# EasyEDA Pro project li-chuang-kai-fa-ban-li-chuang-coloreasypico2-kai-fa-ban-7911d14e.epro, schematic Schematic1_V1.0.4
Board Name: ColorEasyPico2_V1.0.4; Create Date: 2025-02-17; Page Name: P1; Project Name: 立创·ColorEasyPico2开发板; Schematic Name: Schematic1_V1.0.4; Update Date: 2025-02-19; Company: 嘉立创EDA; Page Size: A4; Reviewed: 嘉立创EDA
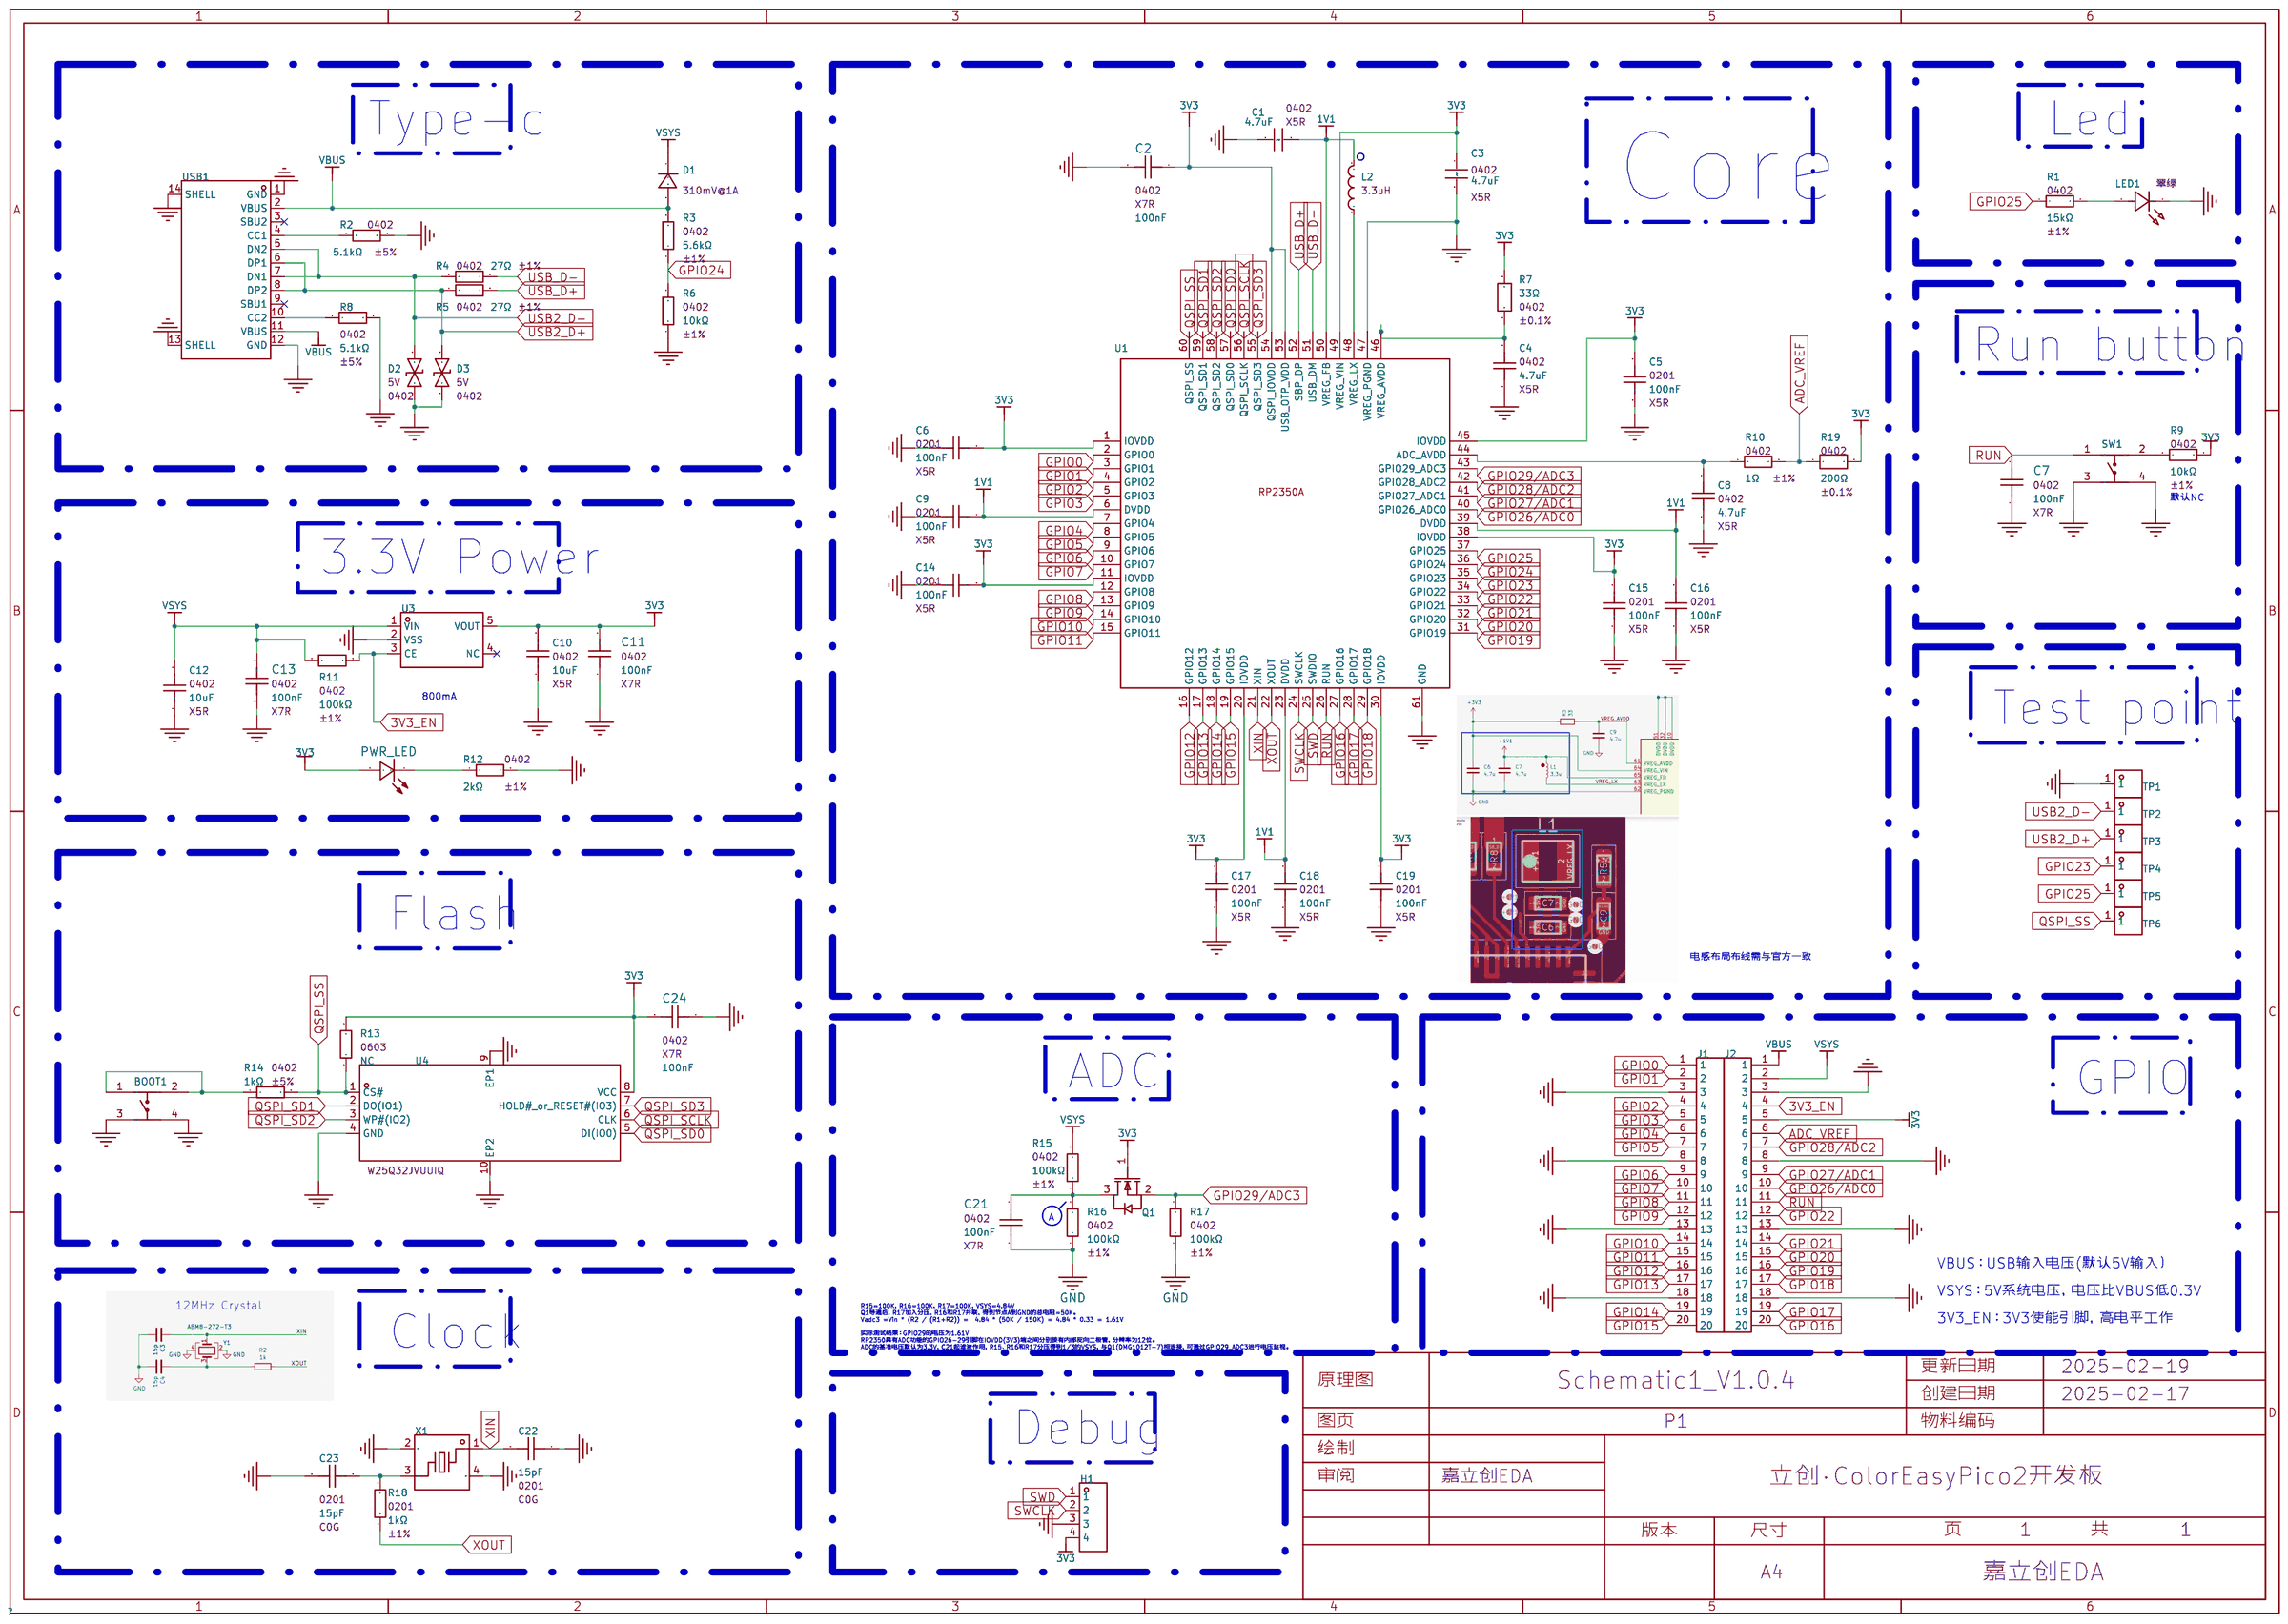
[diagram p0: schematic sheet]

## Parts
BOOT1  K2-1808SN-A4SW-01  [KEY-SMD_4P-L4.2-W3.2-P2.20-LS5.1-TL]
C1  4.7uF  [C0402]
C2  100nF  [R0402]
C3  4.7uF  [C0402]
C4  4.7uF  [R0402]
C5  100nF  [R0201]
C6  100nF  [R0201]
C7  100nF  [R0402]
C8  4.7uF  [R0402]
C9  100nF  [R0201]
C10  10uF  [R0402]
C11  100nF  [R0402]
C12  10uF  [R0402]
C13  100nF  [R0402]
C14  100nF  [R0201]
C15  100nF  [R0201]
C16  100nF  [R0201]
C17  100nF  [R0201]
C18  100nF  [R0201]
C19  100nF  [R0201]
C21  100nF  [R0402]
C22  15pF  [R0201]
C23  15pF  [R0201]
C24  100nF  [R0402]
D1  DFLS130L-7  [POWERDI-123_L2.8-W1.8-LS3.7-RD]
D2  RCLAMP0521P.TCT-MS  [D0402-BI]
D3  RCLAMP0521P.TCT-MS  [D0402-BI]
H1  2.54-1*4  [HDR-TH_4P-P2.54-V-M-1]  (no BOM)
J1  -  [半孔-孔-20P-2.54-1.27-无丝印]  (no BOM)
J2  -  [半孔-孔-20P-2.54-1.27-无丝印]  (no BOM)
L2  AOTA-B201610S3R3-101-T  [IND-SMD_L2.0-W1.6_AOTA-B201610S3R3-101-T]
LED1  XL-1005UGC  [LED0402-RD_GREEN]
PWR_LED  NCD0402R1  [LED0402-RD]
Q1  DMG1012T-7  [SOT-523-3_L1.6-W0.8-P1.00-LS1.6-BR]
R1  15kΩ  [R0402]
R2  5.1kΩ  [R0402]
R3  5.6kΩ  [R0402]
R4  27Ω  [R0402]
R5  27Ω  [R0402]
R6  10kΩ  [R0402]
R7  33Ω  [R0402]
R8  5.1kΩ  [R0402]
R9  10kΩ  [R0402]  (no BOM)
R10  1Ω  [R0402]
R11  100kΩ  [R0402]
R12  2kΩ  [R0402]
R13  NC  [R0402]  (no BOM)
R14  1kΩ  [R0402]
R15  100kΩ  [R0402]
R16  100kΩ  [R0402]
R17  100kΩ  [R0402]
R18  1kΩ  [R0201]
R19  200Ω  [R0402]
SW1  K2-1808SN-A4SW-01  [KEY-SMD_4P-L4.2-W3.2-P2.20-LS5.1-TL]
TP1  TP-红色测试点  [TESTPOINT-TH_BD3.2]  (no BOM)
TP2  TP-红色测试点  [TESTPOINT-TH_BD3.2]  (no BOM)
TP3  TP-红色测试点  [TESTPOINT-TH_BD3.2]  (no BOM)
TP4  TP-红色测试点  [TESTPOINT-TH_BD3.2]  (no BOM)
TP5  TP-红色测试点  [TESTPOINT-TH_BD3.2]  (no BOM)
TP6  TP-红色测试点  [TESTPOINT-TH_BD3.2]  (no BOM)
U1  RP2350A  [QFN-60_L7.0-W7.0-P0.40-TL-EP3.4]
U3  ME6217C33M5G  [SOT-23-5_L3.0-W1.7-P0.95-LS2.8-BR]
U4  W25Q32JVUUIQ  [USON-8_L4.0-W3.0-P0.80-BL_WINBOND_UU]
USB1  TYPE-C 16PIN 2MD(073)  [USB-C-SMD_TYPE-C-6PIN-2MD-073]
X1  ABM8-272-T3  [CRYSTAL-SMD_4P-L3.2-W2.5-BL]

## Library data of the parts
BOOT1 SW1 = K2-1808SN-A4SW-01: 触点电流:50mA;额定电压(DC):12V;绝缘电阻:100MΩ;电路结构:单刀单掷;安装方式:立贴;按钮形状:椭圆形按钮;带灯:-;作用力:250gf@±30gf;机械寿命:100000;工作温度:-25℃~+85℃;开关长度:4.2mm;开关宽度:3.25mm;开关高度:2.5mm;; Circuit: 单刀单掷; Supplier: LCSC; Datasheet: https://atta.szlcsc.com/upload/public/pdf/source/20180927/C283535_7E7907F3E7B6C1691E1DC87E363D082A.pdf; Manufacturer: 韩国韩荣; Switch Width: 3.25mm; Supplier Part: C92589; Switch Height: 2.5mm; Switch Length: 4.2mm; Actuator Style: 椭圆形按钮; LCSC Part Name: 4.2mm*3.25mm; Mounting Sytle: 立贴; Contact Current: 50mA; Mechanical Life: 100000; Operating Force: 250gf@±30gf; JLCPCB Part Class: Extended Part; Supplier Footprint: SMD; Voltage Rating (DC): 12V; Insulation Resistance: 100MΩ; Operating Temperature: -25℃~+85℃
C1 = CL05A475KP5NRNC: 容值:4.7uF;精度:±10%;额定电压:10V;材质(温度系数):X5R;; LCSC Part Name: 4.7uF ±10% 10V; Supplier Part: C368809; Manufacturer: SAMSUNG(三星); Supplier Footprint: 0402; JLCPCB Part Class: Extended Part; Datasheet: https://atta.szlcsc.com/upload/public/pdf/source/20160218/1457707763339.pdf; Supplier: LCSC; Tolerance: ±10%; Voltage Rated: 10V; Temperature Coefficient: X5R
C2 C7 C11 C13 C21 C24 = GRM155R71H104KE14D: 容值:100nF;精度:±10%;额定电压:50V;材质(温度系数):X7R;; Supplier: LCSC; Datasheet: https://atta.szlcsc.com/upload/public/pdf/source/20180326/C77020_39BD49C951FF1AF0DB1F1FAC5AC1E401.pdf; Tolerance: ±10%; Manufacturer: muRata(村田); Supplier Part: C77020; Voltage Rated: 50V; LCSC Part Name: 100nF ±10% 50V; JLCPCB Part Class: 扩展库; Supplier Footprint: 0402; Temperature Coefficient: X7R
C3 C4 C8 = CL05A475KP5NRNC: 容值:4.7uF;精度:±10%;额定电压:10V;材质(温度系数):X5R;; LCSC Part Name: 4.7uF ±10% 10V; Supplier Part: C368809; Manufacturer: SAMSUNG(三星); Supplier Footprint: 0402; JLCPCB Part Class: 扩展库; Datasheet: https://atta.szlcsc.com/upload/public/pdf/source/20160218/1457707763339.pdf; Supplier: LCSC; Tolerance: ±10%; Voltage Rated: 10V; Temperature Coefficient: X5R
C5 C6 C9 C14-C19 = CL03A104KQ3NNNC: 容值:100nF;精度:±10%;额定电压:6.3V;材质(温度系数):X5R;; LCSC Part Name: 100nF ±10% 6.3V; Supplier Part: C160831; Manufacturer: SAMSUNG(三星); Supplier Footprint: 0201; JLCPCB Part Class: Extended Part; Datasheet: https://atta.szlcsc.com/upload/public/pdf/source/20171228/C163510_15144412327381213809.pdf; Supplier: LCSC; Tolerance: ±10%; Voltage Rated: 6.3V; Temperature Coefficient: X5R
C10 C12 = GRM155R61A106ME44D: 容值:10uF;精度:±20%;额定电压:10V;材质(温度系数):X5R;; Supplier: LCSC; Datasheet: https://atta.szlcsc.com/upload/public/pdf/source/20180530/C77000_4866797CFE3A842CD03C597EBD6AE6CD.pdf; Tolerance: ±20%; Manufacturer: muRata(村田); Supplier Part: C77000; Voltage Rated: 10V; LCSC Part Name: 10uF ±20% 10V; JLCPCB Part Class: 扩展库; Supplier Footprint: 0402; Temperature Coefficient: X5R
C22 C23 = GRM0335C1H150JA01D: 容值:15pF;精度:±5%;额定电压:50V;材质(温度系数):C0G;; LCSC Part Name: 15pF ±5% 50V; Supplier Part: C85891; Manufacturer: muRata(村田); Supplier Footprint: 0201; JLCPCB Part Class: Extended Part; Datasheet: https://atta.szlcsc.com/upload/public/pdf/source/20200305/C490387_23319AE8C154DEB24C505E6C82A8106A.pdf; Supplier: LCSC; Tolerance: ±5%; Voltage Rated: 50V; Temperature Coefficient: C0G
D1 = DFLS130L-7: 正向压降(Vf):310mV@1A;直流反向耐压(Vr):30V;平均整流电流(Io):1A;; LCSC Part Name: 电压:30V 电流:1A; Supplier Part: C110493; Manufacturer: DIODES(美台); Supplier Footprint: Power-DI-123; JLCPCB Part Class: Extended Part; Datasheet: https://atta.szlcsc.com/upload/public/pdf/source/20170427/1493286393645.pdf; Supplier: LCSC; Forward Voltage (Vf@If): 310mV@1A; Reverse Voltage (Vr): 30V; Average Rectified Current (Io): 1A
D2 D3 = RCLAMP0521P.TCT-MS: 反向截止电压(Vrwm):5V;最大钳位电压:25V;峰值脉冲电流(Ipp):4A;峰值脉冲功率(Ppp):100W@8/20us;击穿电压:6V;; LCSC Part Name: 双向TVS 5V截止 4A峰值脉冲 丝印N; Supplier Part: C3029033; Manufacturer: MSKSEMI(美森科); Supplier Footprint: 0402; Datasheet: https://atta.szlcsc.com/upload/public/pdf/source/20241122/065B97447663A10C2622E9EC7EE625AB.pdf; Supplier: LCSC; Reverse Stand-Off Voltage (Vrwm): 5V; Maximum Clamping Voltage: 25V; Peak Pulse Current (Ipp): 4A; Peak Pulse Power Dissipation (Ppp): 100W@8/20us; Breakdown Voltage: 6V; Reverse Leakage Current (Ir): 100nA; Type: TVS
H1 = 2.54-1*4: 插针结构:1x4P;间距:2.54mm;排数:单排;总PIN位数:4P;; Supplier Part: NC; Manufacturer: ZHOURI(洲日); Supplier Footprint: 插件,P=2.54mm; JLCPCB Part Class: 扩展库; Datasheet: https://atta.szlcsc.com/upload/public/pdf/source/20220729/BC3442D33C9CDBB7F5DC20B12A8605A8.pdf; Supplier: LCSC; Pin Structure: 1x4P; Pitch: 2.54mm; Number of Rows: 单排; Number of Pins: 4P
J1 J2 = 半孔-孔-20P-2.54-1.27-无丝印
L2 = AOTA-B201610S3R3-101-T: Supplier Part: C42411119; Manufacturer: ABRACON; Supplier Footprint: 0806; JLCPCB Part Class: Extended Part; Datasheet: https://atta.szlcsc.com/upload/public/pdf/source/20241210/8ED7235334351200B2CE75E3CBC0DAAD.pdf; Supplier: LCSC; Inductance: 3.3uH
LED1 = XL-1005UGC: 发光颜色:翠绿;主波长:516nm;色温:-;功率:80mW;安装方式:正贴;; Supplier: LCSC; Datasheet: https://atta.szlcsc.com/upload/public/pdf/source/20221102/FF8D6BC2225363A60A01D46BB802F217.pdf; Lens Color: 无色透明; Manufacturer: XINGLIGHT(成兴光); Emitted Color: 翠绿; Supplier Part: C2856703; Viewing Angle: 120°; LCSC Part Name: 正贴; Mounting Sytle: 正贴; Forward Current: 25mA; Peak Wavelength: 531nm; JLCPCB Part Class: Extended Part; Power Dissipation: 80mW; Supplier Footprint: 0402; Dominant Wavelength: 516nm; Operating Temperature: -30℃~+85℃
PWR_LED = NCD0402R1: 发光颜色:红灯;; Supplier: LCSC; Datasheet: https://atta.szlcsc.com/upload/public/pdf/source/20200820/C130719_A72EA5A7FEC83C35856EA0453E4EE775.pdf; Manufacturer: 国星光电; Emitted Color: 红灯; Supplier Part: C130719; JLCPCB Part Class: 扩展库; Supplier Footprint: 0402
Q1 = DMG1012T-7: 类型:N沟道;漏源电压(Vdss):20V;连续漏极电流(Id):630mA;功率(Pd):280mW;导通电阻(RDS(on)@Vgs,Id):400mΩ@4.5V,600mA;阈值电压(Vgs(th)@Id):1V@250A;; LCSC Part Name: N沟道 20V 630mA; Supplier Part: C20512; Manufacturer: DIODES(美台); Supplier Footprint: SOT-523; JLCPCB Part Class: 扩展库; Datasheet: https://atta.szlcsc.com/upload/public/pdf/source/20170427/1493286410765.pdf; Supplier: LCSC; Type: N沟道; Drain Source Voltage (Vdss): 20V; Continuous Drain Current (Id): 630mA; Power Dissipation (Pd): 280mW; Drain Source On Resistance (RDS(on)@Vgs,Id): 400mΩ@4.5V,600mA; Gate Threshold Voltage (Vgs(th)@Id): 1V@250A
R1 = 0402WGF1502TCE: 电阻类型:厚膜电阻;阻值:15kΩ;精度:±1%;功率:62.5mW;; Type: 厚膜电阻; Supplier: LCSC; Datasheet: https://atta.szlcsc.com/upload/public/pdf/source/20200306/C422600_1E6D84923E4A46A82E41ADD87F860B5C.pdf; Tolerance: ±1%; Manufacturer: UNI-ROYAL(厚声); Power(Watts): 62.5mW; Supplier Part: C25756; LCSC Part Name: 15kΩ ±1% 62.5mW; JLCPCB Part Class: Basic Part; Supplier Footprint: 0402; Overload Voltage (Max): 50V; Temperature Coefficient: ±100ppm/℃; Operating Temperature Range: -55℃~+155℃
R2 R8 = 0402WGJ0512TCE: 电阻类型:厚膜电阻;阻值:5.1kΩ;精度:±5%;功率:62.5mW;最大工作电压:50V;温度系数:±100ppm/℃;; LCSC Part Name: 5.1kΩ ±5% 62.5mW 厚膜电阻; Supplier Part: C25941; Manufacturer: UNI-ROYAL(厚声); Supplier Footprint: 0402; JLCPCB Part Class: 扩展库; Datasheet: https://atta.szlcsc.com/upload/public/pdf/source/20200306/C422600_1E6D84923E4A46A82E41ADD87F860B5C.pdf; Supplier: LCSC; Type: 厚膜电阻; Tolerance: ±5%; Power(Watts): 62.5mW; Overload Voltage (Max): 50V; Temperature Coefficient: ±100ppm/℃; Operating Temperature Range: -55℃~+155℃
R3 = 0402WGF5601TCE: 电阻类型:厚膜电阻;阻值:5.6kΩ;精度:±1%;功率:62.5mW;最大工作电压:50V;温度系数:±100ppm/℃;; LCSC Part Name: 5.6kΩ ±1% 62.5mW 厚膜电阻; Supplier Part: C25908; Manufacturer: UNI-ROYAL(厚声); Supplier Footprint: 0402; JLCPCB Part Class: 扩展库; Datasheet: https://atta.szlcsc.com/upload/public/pdf/source/20200306/C422600_1E6D84923E4A46A82E41ADD87F860B5C.pdf; Supplier: LCSC; Type: 厚膜电阻; Tolerance: ±1%; Power(Watts): 62.5mW; Overload Voltage (Max): 50V; Temperature Coefficient: ±100ppm/℃; Operating Temperature Range: -55℃~+155℃
R4 R5 = 0402WGF270JTCE: 电阻类型:厚膜电阻;阻值:27Ω;精度:±1%;功率:62.5mW;最大工作电压:50V;温度系数:±100ppm/℃;; LCSC Part Name: 27Ω ±1% 62.5mW 厚膜电阻; Supplier Part: C25100; Manufacturer: UNI-ROYAL(厚声); Supplier Footprint: 0402; JLCPCB Part Class: Extended Part; Datasheet: https://atta.szlcsc.com/upload/public/pdf/source/20200306/C422600_1E6D84923E4A46A82E41ADD87F860B5C.pdf; Supplier: LCSC; Type: 厚膜电阻; Tolerance: ±1%; Power(Watts): 62.5mW; Overload Voltage (Max): 50V; Temperature Coefficient: ±100ppm/℃; Operating Temperature Range: -55℃~+155℃
R6 R9 = RC0402FR-0710KL: 电阻类型:厚膜电阻;阻值:10kΩ;精度:±1%;功率:62.5mW;最大工作电压:50V;温度系数:±100ppm/℃;; LCSC Part Name: 厚膜电阻 10kΩ ±1% 62.5mW; Supplier Part: C60490; Manufacturer: YAGEO(国巨); Supplier Footprint: 0402; Datasheet: https://atta.szlcsc.com/upload/public/pdf/source/20170925/C131467_1506321478108990263.pdf; Supplier: LCSC; Type: 厚膜电阻; Tolerance: ±1%; Power(Watts): 62.5mW; Overload Voltage (Max): 50V; Temperature Coefficient: ±100ppm/℃; Operating Temperature Range: -55℃~+155℃
R7 = RT0402BRD0733RL: 电阻类型:薄膜电阻;阻值:33Ω;精度:±0.1%;功率:63mW;温度系数:±25ppm/℃;; LCSC Part Name: 薄膜电阻 33Ω ±0.1% 63mW; Supplier Part: C852729; Manufacturer: YAGEO(国巨); Supplier Footprint: 0402; JLCPCB Part Class: 扩展库; Datasheet: https://atta.szlcsc.com/upload/public/pdf/source/20200610/C326738_5639A9F1B6EB6E4AE2197577D3456E7F.pdf; Supplier: LCSC; Type: 薄膜电阻; Tolerance: ±0.1%; Power(Watts): 63mW; Temperature Coefficient: ±25ppm/℃; Operating Temperature Range: -55℃~+155℃
R10 = RC0402FR-071RL: 电阻类型:厚膜电阻;阻值:1Ω;精度:±1%;功率:62.5mW;最大工作电压:50V;温度系数:±200ppm/℃;; LCSC Part Name: 厚膜电阻 1Ω ±1% 62.5mW; Supplier Part: C185446; Manufacturer: YAGEO(国巨); Supplier Footprint: 0402; JLCPCB Part Class: Extended Part; Datasheet: https://atta.szlcsc.com/upload/public/pdf/source/20180904/C276339_014E484F1DBA106FB92D45EABD5A1AC1.pdf; Supplier: LCSC; Type: 厚膜电阻; Tolerance: ±1%; Power(Watts): 62.5mW; Overload Voltage (Max): 50V; Temperature Coefficient: ±200ppm/℃; Operating Temperature Range: -55℃~+155℃
R11 R15-R17 = RC0402FR-07100KL: 电阻类型:厚膜电阻;阻值:100kΩ;精度:±1%;功率:62.5mW;最大工作电压:50V;温度系数:±100ppm/℃;; LCSC Part Name: 厚膜电阻 100kΩ ±1% 62.5mW; Supplier Part: C60491; Manufacturer: YAGEO(国巨); Supplier Footprint: 0402; JLCPCB Part Class: Extended Part; Datasheet: https://atta.szlcsc.com/upload/public/pdf/source/20180927/C295883_E8D83085EA81BD7DE0B2B681138C15EE.pdf; Supplier: LCSC; Type: 厚膜电阻; Tolerance: ±1%; Power(Watts): 62.5mW; Overload Voltage (Max): 50V; Temperature Coefficient: ±100ppm/℃; Operating Temperature Range: -55℃~+155℃
R12 = 0402WGF2001TCE: 电阻类型:厚膜电阻;阻值:2kΩ;精度:±1%;功率:62.5mW;; Type: 厚膜电阻; Supplier: LCSC; Datasheet: https://atta.szlcsc.com/upload/public/pdf/source/20200306/C422600_1E6D84923E4A46A82E41ADD87F860B5C.pdf; Tolerance: ±1%; Manufacturer: UNI-ROYAL(厚声); Power(Watts): 62.5mW; Supplier Part: C4109; LCSC Part Name: 2kΩ ±1% 62.5mW; JLCPCB Part Class: 基础库; Supplier Footprint: 0402; Overload Voltage (Max): 50V; Temperature Coefficient: ±100ppm/℃; Operating Temperature Range: -55℃~+155℃
R13 = Res_0603: Supplier Footprint: 0603
R14 = 0402WGJ0102TCE: 电阻类型:厚膜电阻;阻值:1kΩ;精度:±5%;功率:62.5mW;; Type: 厚膜电阻; Supplier: LCSC; Datasheet: https://atta.szlcsc.com/upload/public/pdf/source/20200306/C422600_1E6D84923E4A46A82E41ADD87F860B5C.pdf; Tolerance: ±5%; Manufacturer: UNI-ROYAL(厚声); Power(Watts): 62.5mW; Supplier Part: C25543; LCSC Part Name: 1kΩ ±5% 62.5mW; JLCPCB Part Class: Extended Part; Supplier Footprint: 0402; Overload Voltage (Max): 50V; Temperature Coefficient: ±100ppm/℃; Operating Temperature Range: -55℃~+155℃
R18 = 0201WMF1001TEE: 电阻类型:厚膜电阻;阻值:1kΩ;精度:±1%;功率:50mW;最大工作电压:25V;温度系数:±200ppm/℃;; LCSC Part Name: 1kΩ ±1% 50mW 厚膜电阻; Supplier Part: C270365; Manufacturer: UNI-ROYAL(厚声); Supplier Footprint: 0201; JLCPCB Part Class: Extended Part; Datasheet: https://atta.szlcsc.com/upload/public/pdf/source/20200306/C422600_1E6D84923E4A46A82E41ADD87F860B5C.pdf; Supplier: LCSC; Type: 厚膜电阻; Tolerance: ±1%; Power(Watts): 50mW; Overload Voltage (Max): 25V; Temperature Coefficient: ±200ppm/℃; Operating Temperature Range: -55℃~+155℃
R19 = RT0402BRD07200RL: 电阻类型:薄膜电阻;阻值:200Ω;精度:±0.1%;功率:62.5mW;温度系数:±25ppm/℃;; LCSC Part Name: 薄膜电阻 200Ω ±0.1% 62.5mW; Supplier Part: C852625; Manufacturer: YAGEO(国巨); Supplier Footprint: 0402; JLCPCB Part Class: 扩展库; Datasheet: https://atta.szlcsc.com/upload/public/pdf/source/20200610/C326738_5639A9F1B6EB6E4AE2197577D3456E7F.pdf; Supplier: LCSC; Type: 薄膜电阻; Tolerance: ±0.1%; Power(Watts): 62.5mW; Temperature Coefficient: ±25ppm/℃; Operating Temperature Range: -55℃~+155℃
TP1-TP6 = TP-红色测试点: Supplier Part: C9900007423; Supplier Footprint: TESTPOINT-TH_BD-2P-P2.00; Supplier: LCSC
U1 = RP2350A_C42411118: 推荐配套ABRACON  C42411119使用; Supplier Part: C42411118; Manufacturer: Raspberry Pi(树莓派); Supplier Footprint: QFN-60-EP(7x7); JLCPCB Part Class: Extended Part; Datasheet: https://atta.szlcsc.com/upload/public/pdf/source/20241210/0989AB86AAD7A21936E5CD12ADC9EA29.pdf; Supplier: LCSC
U3 = ME6217C33M5G: 输出类型:固定;输出极性:正;最大输入电压:7V;输出电压:3.3V;输出电流:800mA;电源纹波抑制比(PSRR):65dB@(1kHz);; Supplier: LCSC; Datasheet: https://atta.szlcsc.com/upload/public/pdf/source/20190910/C427602_D4B9162A2E9D9EF57C60010DFDECEF37.pdf; Output Type: 固定; Manufacturer: MICRONE(南京微盟); Supplier Part: C427602; Output Current: 800mA; Output Voltage: 3.3V; Dropout Voltage: 180mV@(300mA); Output Polarity: 正; JLCPCB Part Class: 扩展库; Number of Outputs: 1; Supplier Footprint: SOT-23-5; Maximum Input Voltage: 7V; Power Supply Rejection Ratio (PSRR): 65dB@(1kHz)
U4 = W25Q32JVUUIQ: 3V 32M-BIT SERIAL FLASH MEMORY WITH DUAL, QUAD SPI; Supplier Part: C2999380; Manufacturer: WINBOND(华邦); Supplier Footprint: USON-8(3x4); JLCPCB Part Class: 扩展库; Datasheet: https://atta.szlcsc.com/upload/public/pdf/source/20220419/71F2D20BDA1217995CECC027DED216BE.pdf; Supplier: LCSC
USB1 = TYPE-C 16PIN 2MD(073): 连接器类型:Type-C;标准:-;公母:母;端口数量:1;触点数量:16P;安装方式:卧贴;额定电流 - 电源:5A;工作温度范围:-25℃~+85℃;; LCSC Part Name: Type-C 母 卧贴; Supplier Part: C2765186; Manufacturer: SHOU HAN(首韩); Supplier Footprint: SMD; JLCPCB Part Class: 扩展库; Datasheet: https://atta.szlcsc.com/upload/public/pdf/source/20211123/39B17C16241EAC15C5E277BDA434118E.pdf; Supplier: LCSC; Connector Type: Type-C; Gender: 母; Number of Ports: 1; Number of Contacts: 16P; Mounting Style: 卧贴; Current Rating - Power (Max): 5A; Operating Temperature Range: -25℃~+85℃
X1 = ABM8-272-T3_C20625731: 推荐配套使用产品C20625731    ABM8-272-T3 与 C2040   RP2040; Supplier Part: C20625731; Manufacturer: ABRACON; Supplier Footprint: SMD3225-4P; JLCPCB Part Class: Extended Part; Datasheet: https://atta.szlcsc.com/upload/public/pdf/source/20240227/A8BE43F636D80F75C9AF5C59EDF21E9A.pdf; Supplier: LCSC

## Nets
1V1: C1.2 C9.1 C16.2 C18.1 L2.2 U1.6(DVDD) U1.23(DVDD) U1.39(DVDD) U1.50(VREG_FB)
3V3: C2.1 C3.1 C5.2 C6.1 C10.2 C11.2 C14.1 C15.2 C17.1 C19.1 C24.2 H1.4 J2.5 PWR_LED.2(A) Q1.1(G) R7.2 R9.1 R13.2 R19.2 U1.1(IOVDD) U1.11(IOVDD) U1.20(IOVDD) U1.30(IOVDD) U1.38(IOVDD) U1.45(IOVDD) U1.49(VREG_VIN) U1.53(USB_OTP_VDD) U1.54(QSPI_IOVDD) U3.5(VOUT) U4.8(VCC)
3V3_EN: J2.4 R11.2 U3.3(CE)
GND: BOOT1.3 BOOT1.4 C1.1 C2.2 C3.2 C4.2 C5.1 C6.2 C7.1 C8.2 C9.2 C10.1 C11.1 C12.1 C13.1 C14.2 C15.1 C16.1 C17.2 C18.2 C19.2 C21.1 C22.1 C23.2 C24.1 D2.1 D3.1 H1.3 J1.3 J1.8 J1.13 J1.18 J2.3 J2.8 J2.13 J2.18 LED1.1(K) R2.2 R6.1 R8.2 R12.2 R16.1 R17.1 SW1.3 SW1.4 TP1.1 U1.47(VREG_PGND) U1.61(GND) U3.2(VSS) U4.4(GND) U4.9(EP1) U4.10(EP2) USB1.1(GND) USB1.12(GND) USB1.13(SHELL) USB1.14(SHELL) X1.2(GND) X1.4(GND)
VBUS: D1.2 J2.1 R3.2 USB1.2(VBUS) USB1.11(VBUS)
ADC_VREF: J2.6 R10.2 R19.1
GPIO0: J1.1 U1.2(GPIO0)
GPIO1: J1.2 U1.3(GPIO1)
GPIO2: J1.4 U1.4(GPIO2)
GPIO3: J1.5 U1.5(GPIO3)
GPIO4: J1.6 U1.7(GPIO4)
GPIO5: J1.7 U1.8(GPIO5)
GPIO6: J1.9 U1.9(GPIO6)
GPIO7: J1.10 U1.10(GPIO7)
GPIO8: J1.11 U1.12(GPIO8)
GPIO9: J1.12 U1.13(GPIO9)
GPIO10: J1.14 U1.14(GPIO10)
GPIO11: J1.15 U1.15(GPIO11)
GPIO12: J1.16 U1.16(GPIO12)
GPIO13: J1.17 U1.17(GPIO13)
GPIO14: J1.19 U1.18(GPIO14)
GPIO15: J1.20 U1.19(GPIO15)
GPIO16: J2.20 U1.27(GPIO16)
GPIO17: J2.19 U1.28(GPIO17)
GPIO18: J2.17 U1.29(GPIO18)
GPIO19: J2.16 U1.31(GPIO19)
GPIO20: J2.15 U1.32(GPIO20)
GPIO21: J2.14 U1.33(GPIO21)
GPIO22: J2.12 U1.34(GPIO22)
GPIO23: TP4.1 U1.35(GPIO23)
GPIO24: R3.1 R6.2 U1.36(GPIO24)
GPIO25: R1.1 TP5.1 U1.37(GPIO25)
GPIO26/ADC0: J2.10 U1.40(GPIO26_ADC0)
GPIO27/ADC1: J2.9 U1.41(GPIO27_ADC1)
GPIO28/ADC2: J2.7 U1.42(GPIO28_ADC2)
GPIO29/ADC3: Q1.2(S) R17.2 U1.43(GPIO29_ADC3)
QSPI_SCLK: U1.56(QSPI_SCLK) U4.6(CLK)
QSPI_SD0: U1.57(QSPI_SD0) U4.5(DI(IO0))
QSPI_SD1: U1.59(QSPI_SD1) U4.2(DO(IO1))
QSPI_SD2: U1.58(QSPI_SD2) U4.3(WP#(IO2))
QSPI_SD3: U1.55(QSPI_SD3) U4.7(HOLD# or RESET#(IO3))
QSPI_SS: R13.1 R14.2 TP6.1 U1.60(QSPI_SS) U4.1(CS#)
RUN: C7.2 J2.11 SW1.1 U1.26(RUN)
SWCLK: H1.2 U1.24(SWCLK)
SWD: H1.1 U1.25(SWDIO)
USB2_D+: D3.2 R5.1 TP3.1 USB1.6(DP1) USB1.8(DP2)
USB2_D-: D2.2 R4.1 TP2.1 USB1.5(DN2) USB1.7(DN1)
USB_D+: R5.2 U1.52(SBP_DP)
USB_D-: R4.2 U1.51(USB_DM)
VSYS: C12.2 C13.2 D1.1 J2.2 R11.1 R15.2 U3.1(VIN)
XIN: C22.2 U1.21(XIN) X1.1
XOUT: R18.1 U1.22(XOUT)
$1N7955: C23.1 R18.2 X1.3
$1N8040: C21.2 Q1.3(D) R15.1 R16.2
$1N8088: R2.1 USB1.4(CC1)
$1N8089: R8.1 USB1.10(CC2)
$1N8094: LED1.2(A) R1.2
$1N15224: L2.1 U1.48(VREG_LX)
$1N16315: C4.1 R7.1 U1.46(VREG_AVDD)
$1N16648: C8.1 R10.1 U1.44(ADC_AVDD)
$1N24312: BOOT1.1 BOOT1.2 R14.1
$1N32447: PWR_LED.1(K) R12.1
$1N32723: R9.2 SW1.2

Not connected (* = marked no-connect by the designer): U3 4(NC)*; USB1 3(SBU2)* 9(SBU1)*

## Notes on the sheet
- Type-c
- Led
- Core
- Run button
- 默认NC
- 3.3V Power
- 800mA
- Test point
- Flash
- 电感布局布线需与官方一致
- ADC
- GPIO
- A
- VBUS：USB输入电压(默认5V输入）
- R15=100K，R16=100K，R17=100K，VSYS=4.84V
  Q1导通后，R17加入分压，R16和R17并联，得到节点A到GND的总电阻=50K。
  Vadc3 =Vin * (R2 / (R1+R2)) =  4.84 * (50K / 150K) = 4.84 * 0.33 = 1.61V
  实际测试结果：GPIO29的电压为1.61V
- VSYS：5V系统电压，电压比VBUS低0.3V
- 3V3_EN：3V3使能引脚，高电平工作
- RP2350具有ADC功能的GPIO26-29引脚在IOVDD(3V3)端之间分别接有内部反向二极管，分辨率为12位。
  ADC的基准电压默认为3.3V，C21起滤波作用，R15、R16和R17分压得到1/3的VSYS，与Q1(DMG1012T-7)相连接，可通过GPIO29_ADC3进行电压监视。
- Clock
- Debug
